# EasyEDA Pro project realtix-sakura_nfc-d968f2f9.epro, board PCB1
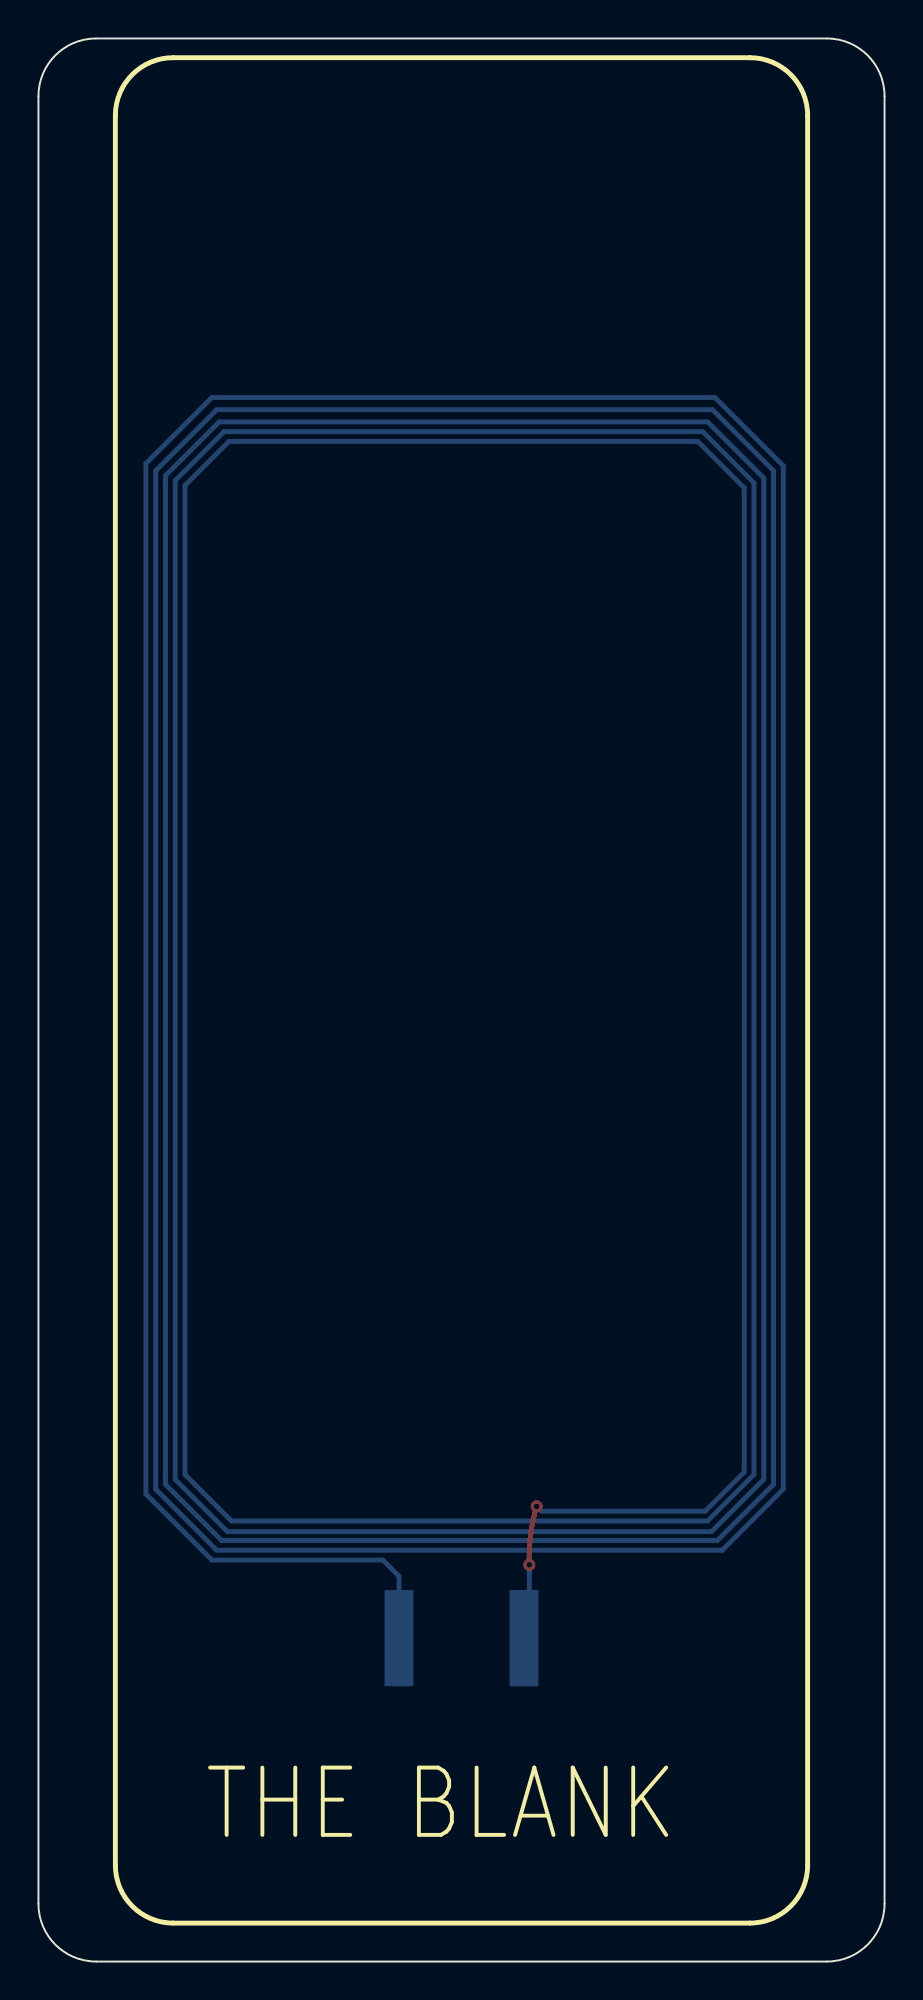
[diagram p6: board, top side]
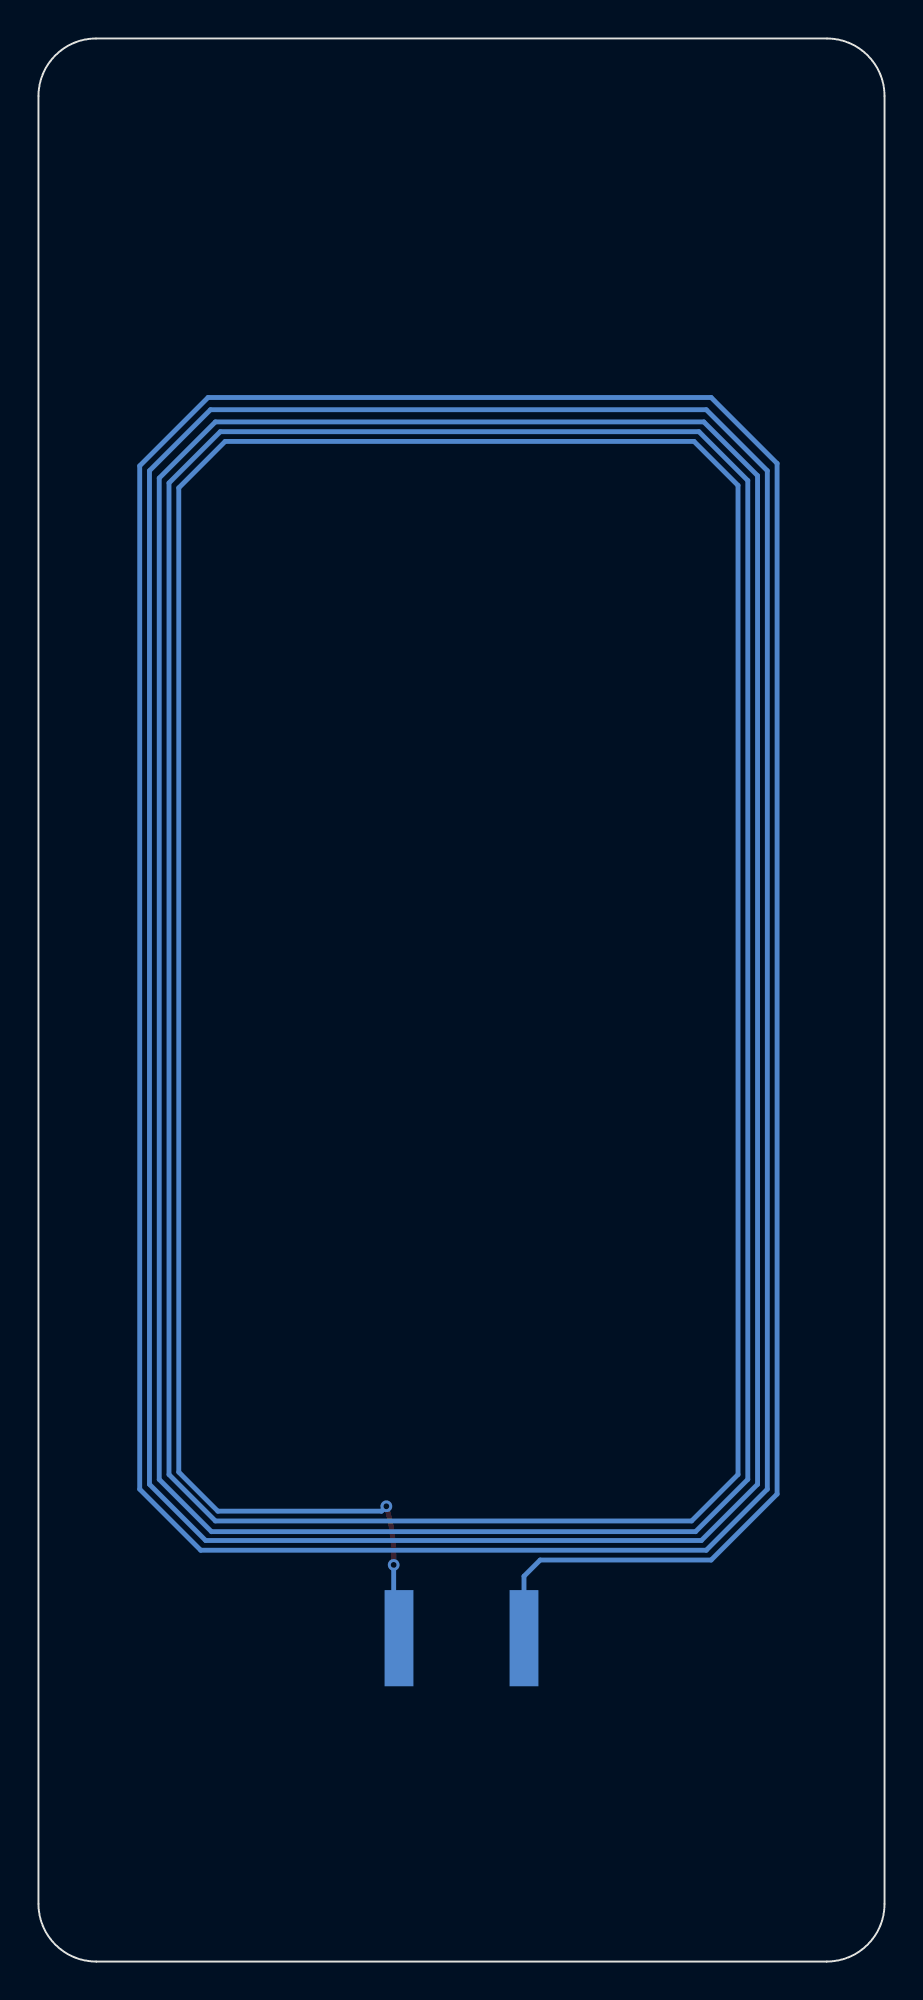
[diagram p7: board, bottom side, seen from below]

Outline 44 x 100 mm; copper layers: Top Layer, Bottom Layer. Coordinates in mm from the lower left corner of the outline.
Outline path: 0,97 arc(0.88,99.12) 3,100 41,100 arc(43.12,99.12) 44,97 44,3 arc(43.12,0.88) 41,0 3,0 arc(0.88,0.88) 0,3 0,97
Stack: Top Layer 0.035mm / Dielectric1 1.51mm FR4 er 4.5 / Bottom Layer 0.035mm

## Design rules (mm)
spacing copperThickness1oz (default): track to track 0.102, other pairs 0.152 to 0.3
spacing copperThickness2oz: track to track 0.203, other pairs 0.152 to 0.3
spacing Plane_innerPlane: track to track 0.102, other pairs 0.152 to 0.3
spacing Copper_copperRegion: track to track 0.102, other pairs 0.152 to 0.3
track width copperThickness1oz (default): min 0.127, default 0.254, max 2.54
track width copperThickness2oz: min 0.203, default 0.254, max 2.54
differential pair differentialPair (default): width min 0.127, default 0.254, max 2.54; gap min 0.152, default 0.152

## Placement (name value [footprint] x y rotation side)
U1  -  [CUID-5X8]  22 16.81 180 bottom

## Footprints (pads in the part's own frame, mm; a bottom-side part is the same pattern mirrored in y, then rotated)
CUID-5X8
  rect 1.5x5 smd: 1(-3.25,0) 2(3.25,0)

## Nets
As in the schematic.

## Via types
v1: diameter 0.61, hole 0.305, Top Layer to Bottom Layer, 2 vias

## Routing (per net, layer and track width the routed paths; a pad name or vN(x,y) marks a point on that pad's centre or on a via; arc(x,y) is an arc through that point)
$1N113: length 861.3
  Top Layer w0.254: v1(25.53,20.62) arc(25.59,22.16) v1(25.91,23.67)
  Bottom Layer w0.254: v1(25.53,20.62) 25.53,17.09 U1.1 ; v1(25.91,23.67) 26.16,23.42 34.67,23.42 36.7,25.45 36.7,76.63 34.29,79.05 9.91,79.05 7.62,76.76 7.62,25.32 10.03,22.91 34.8,22.91 37.21,25.32 37.21,76.89 34.54,79.55 9.65,79.55 7.11,77.01 7.11,25.07 9.83,22.36 35,22.36 37.72,25.07 37.72,77.14 34.8,80.06 9.4,80.06 6.6,77.27 6.6,24.82 9.53,21.9 35.31,21.9 38.23,24.82 38.23,77.52 35.05,80.7 9.27,80.7 6.1,77.52 6.1,24.56 9.27,21.39 35.56,21.39 38.74,24.56 38.74,77.78 35.18,81.33 9.02,81.33 5.59,77.9 5.59,24.31 9.02,20.88 17.91,20.88 18.75,20.04 U1.2

## Text on the board
Top Silkscreen Layer: THE BLANK
